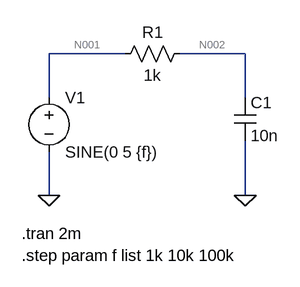
[diagram p0: schematic Seno.asc]
Seno.asc, the LTspice schematic file:
Version 4.1
SHEET 1 880 680
WIRE 144 80 32 80
WIRE 320 80 224 80
WIRE 32 144 32 80
WIRE 320 144 320 80
WIRE 32 288 32 224
WIRE 320 288 320 208
FLAG 32 288 0
FLAG 320 288 0
SYMBOL voltage 32 128 R0
WINDOW 123 0 0 Left 0
WINDOW 39 0 0 Left 0
SYMATTR InstName V1
SYMATTR Value SINE(0 5 {f})
SYMBOL res 240 64 R90
WINDOW 0 0 56 VBottom 2
WINDOW 3 32 56 VTop 2
SYMATTR InstName R1
SYMATTR Value 1k
SYMBOL cap 304 144 R0
SYMATTR InstName C1
SYMATTR Value 10n
TEXT -8 344 Left 2 !.tran 2m
TEXT -8 376 Left 2 !.step param f list 1k 10k 100k

The netlist it stands for:
* Seno.asc
V1 N001 0 SINE(0 5 {f})
R1 N002 N001 1k
C1 N002 0 10n
.tran 2m
.step param f list 1k 10k 100k
.backanno
.end

* Results of the author's LTspice run, read from the files saved beside the schematic
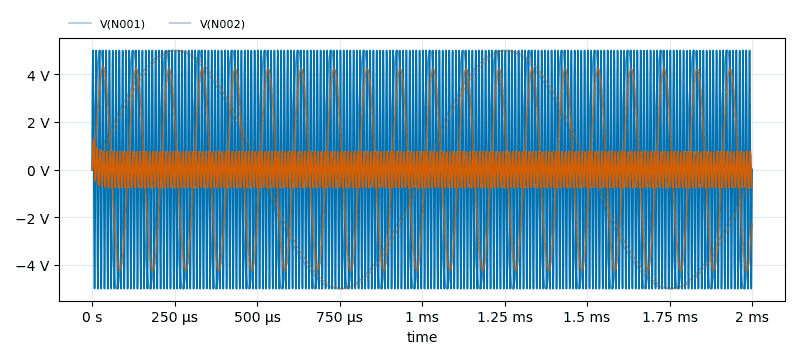
[diagram p1: Transient Analysis of Seno.asc, plotted from the saved traces]
* Transient Analysis, 3 runs:
*   V(N001) [f=1000]: min -5 V, max 5 V, average 0 V, rms 3.536 V, last 0 V
*   V(N001) [f=10000]: min -5 V, max 5 V, average 0 V, rms 3.536 V, last 0 V
*   V(N001) [f=100000]: min -5 V, max 5 V, average 46.05 µV, rms 3.591 V, last 0 V
*   V(N002) [f=1000]: min -4.99 V, max 4.99 V, average 1.565 mV, rms 3.529 V, last -312.9 mV
*   V(N002) [f=10000]: min -4.232 V, max 4.308 V, average 11.27 mV, rms 2.995 V, last -2.253 V
*   V(N002) [f=100000]: min -772.2 mV, max 1.258 V, average 3.86 mV, rms 541.7 mV, last -762.7 mV